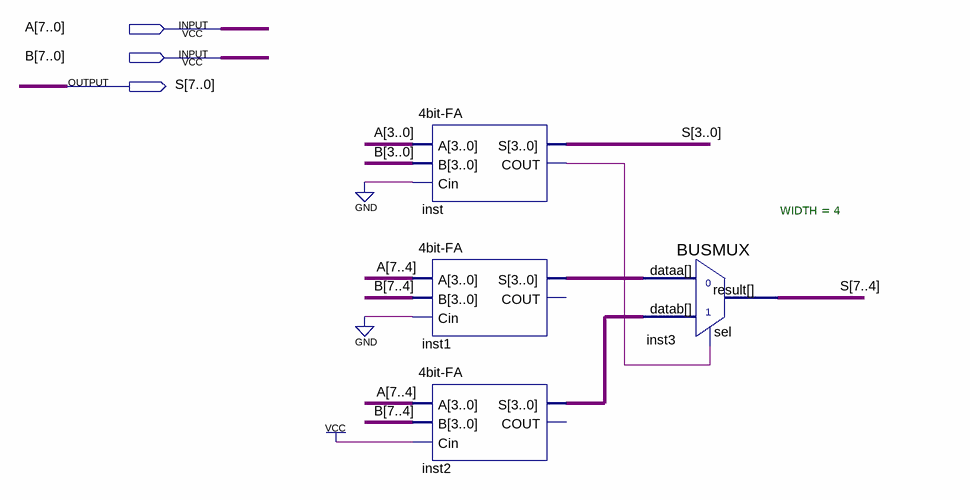
[diagram p0: schematic sheet]
// Quartus schematic 8bit-CSA.bdf as structural Verilog: 4 symbols, 3 pins
module \8bit-CSA  (
  input  [7:0] A,
  input  [7:0] B,
  output [7:0] S
);

  wire inst_cout;
  wire [3:0] inst1_s, inst2_s;

  \4bit-FA  inst (.A(A[3:0]), .B(B[3:0]), .Cin(1'b0), .S(S[3:0]), .COUT(inst_cout));
  \4bit-FA  inst1 (.A(A[7:4]), .B(B[7:4]), .Cin(1'b0), .S(inst1_s));  // open: COUT
  \4bit-FA  inst2 (.A(A[7:4]), .B(B[7:4]), .Cin(1'b1), .S(inst2_s));  // open: COUT
  BUSMUX #(.WIDTH(4)) inst3 (.datab(inst2_s), .sel(inst_cout), .dataa(inst1_s), .result(S[7:4]));
endmodule
